# Altium schematic sheet Motor driver.SchDoc
size Letter; SheetNumber: 5; SheetTotal: 7
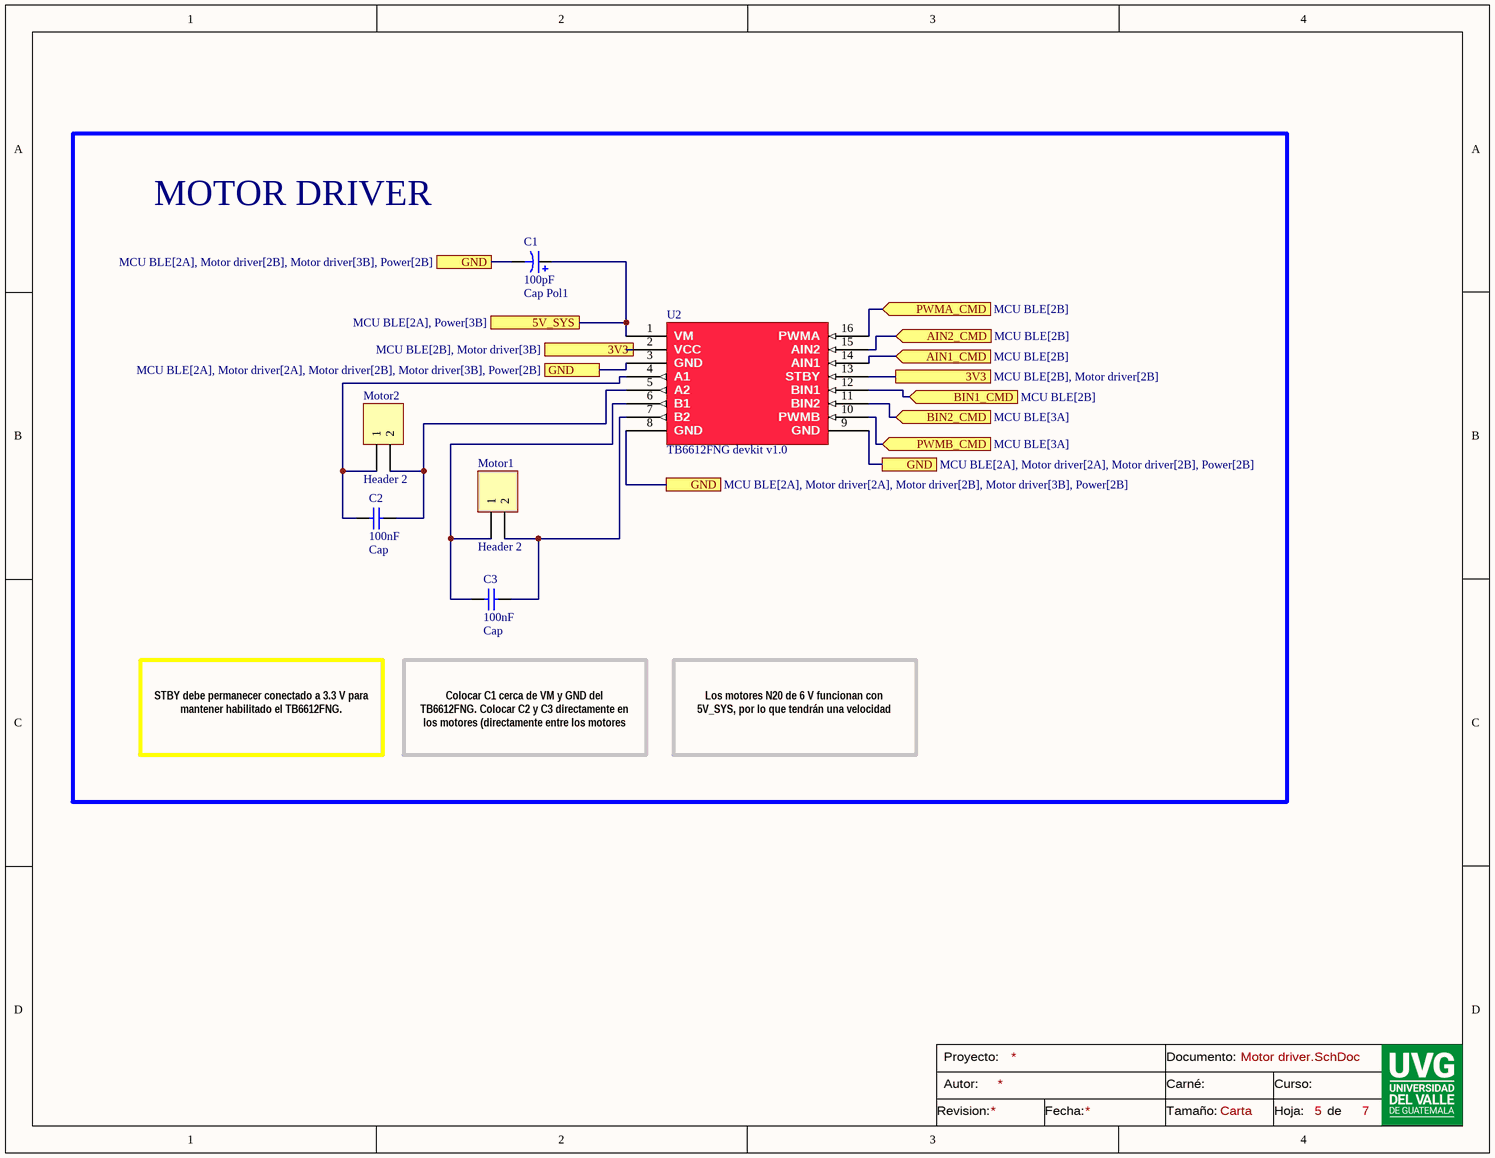
[diagram p0: Motor driver.SchDoc]

## Parts
C1  Cap Pol1  value 100pF  [CAPACITOR1000UF]
C2  Cap  value 100nF  (graphical)
C3  Cap  value 100nF  [RAD-0.3]  (graphical)
Motor1  Header 2  [BORNERAS]
Motor2  Header 2  [BORNERAS]
U2  TB6612FNG devkit v1.0  [TB6612FNG]

## Blocks framed on the sheet
MOTOR DRIVER: C1-C3 Motor1 Motor2 U2

## Ports
3V3 (see MCU BLE[2B], Motor driver[2B]), 3V3 (see MCU BLE[2B], Motor driver[3B]), 5V_SYS (see MCU BLE[2A], Power[3B]), AIN1_CMD (in, see MCU BLE[2B]), AIN2_CMD (in, see MCU BLE[2B]), BIN1_CMD (in, see MCU BLE[2B]), BIN2_CMD (in, see MCU BLE[3A]), GND (see MCU BLE[2A], Motor driver[2A], Motor driver[2B], Motor driver[3B], Power[2B]), GND (see MCU BLE[2A], Motor driver[2A], Motor driver[2B], Power[2B]), GND (see MCU BLE[2A], Motor driver[2B], Motor driver[3B], Power[2B]), PWMA_CMD (in, see MCU BLE[2B]), PWMB_CMD (in, see MCU BLE[3A])

## Nets
3V3: U2.2(VCC) U2.13(STBY) ; port 3V3
5V_SYS: C1.1 U2.1(VM) ; port 5V_SYS
AIN1_CMD: U2.14(AIN1) ; port AIN1_CMD
AIN2_CMD: U2.15(AIN2) ; port AIN2_CMD
BIN1_CMD: U2.12(BIN1) ; port BIN1_CMD
BIN2_CMD: U2.11(BIN2) ; port BIN2_CMD
GND: C1.2 U2.3(GND) U2.8(GND) U2.9(GND) ; port GND
PWMA_CMD: U2.16(PWMA) ; port PWMA_CMD
PWMB_CMD: U2.10(PWMB) ; port PWMB_CMD
NetC2_1: C2.1 Motor2.1 U2.4(A1)
NetC2_2: C2.2 Motor2.2 U2.5(A2)
NetC3_1: C3.1 Motor1.1 U2.6(B1)
NetC3_2: C3.2 Motor1.2 U2.7(B2)

## Notes on the sheet
- STBY debe permanecer conectado a 3.3 V para mantener habilitado el TB6612FNG.
- Colocar C1 cerca de VM y GND del TB6612FNG. Colocar C2 y C3 directamente en los motores (directamente entre los motores fuera del pcb para reducir ruido).
- Los motores N20 de 6 V funcionan con 5V_SYS, por lo que tendrán una velocidad ligeramente menor.
- Proyecto:
- Autor:
- Carné:
- Documento:
- Curso:
- Revision:
- Fecha:
- Tamaño:
- Carta
- Hoja:      de

## Library data of the parts
C1 = Cap Pol1: Polarized Capacitor (Radial); Published: 8-Jun-2000; LatestRevisionDate: 17-Jul-2002; LatestRevisionNote: Re-released for DXP Platform.; PackageReference: RB7.6-15; Publisher: Altium Limited; PackageDescription: Polarized Capacitor (Radial); 2 Leads
C2 C3 = Cap: Capacitor; Published: 8-Jun-2000; LatestRevisionDate: 17-Jul-2002; LatestRevisionNote: Re-released for DXP Platform.; PackageReference: RAD-0.3; Publisher: Altium Limited; PackageDescription: Radial Cap, Thru-Hole; 2 Leads; 0.3 in Pin Spacing
Motor1 Motor2 = Header 2: Header, 2-Pin; LatestRevisionDate: 17-Jul-2002; LatestRevisionNote: Re-released for DXP Platform.; Publisher: Altium Limited
U2 = TB6612FNG devkit v1.0: Manufacturer: Toshiba